# Altium schematic sheet ffultra_sensors.SchDoc
size A4; SheetNumber: 3; SheetTotal: 12
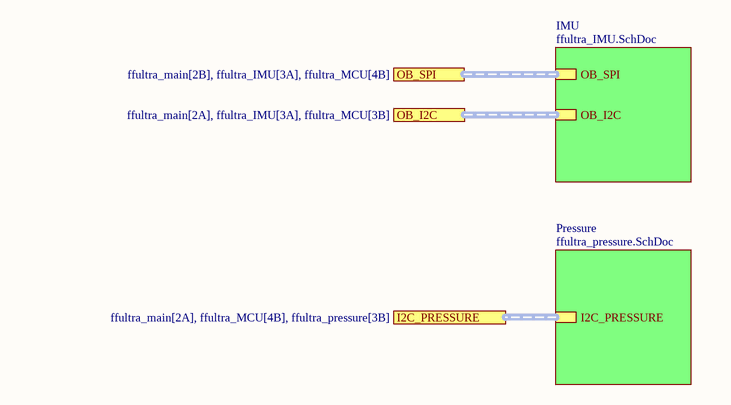
[diagram p0: ffultra_sensors.SchDoc]

## Sub-sheets
IMU = ffultra_IMU.SchDoc: OB_SPI (harness OB_SPI), OB_I2C (harness OB_I2C)
Pressure = ffultra_pressure.SchDoc: I2C_PRESSURE

## Ports
I2C_PRESSURE (harness I2C PRESSURE, see ffultra_main[2A], ffultra_MCU[4B], ffultra_pressure[3B]), OB_I2C (harness OB_I2C, see ffultra_main[2A], ffultra_IMU[3A], ffultra_MCU[3B]), OB_SPI (harness OB_SPI, see ffultra_main[2B], ffultra_IMU[3A], ffultra_MCU[4B])

## Buses and harness runs
harness port I2C_PRESSURE = sheet Pressure/I2C_PRESSURE
harness port OB_I2C = sheet IMU/OB_I2C
harness port OB_SPI = sheet IMU/OB_SPI